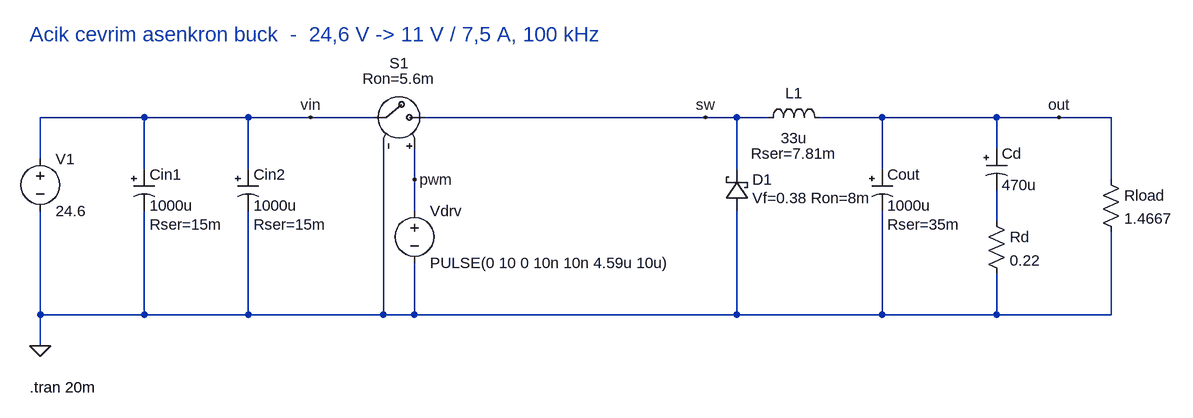
[diagram p0: schematic buck_guc_kati.asc]
buck_guc_kati.asc, the LTspice schematic file:
Version 4
SHEET 1 1760 900
WIRE -320 128 -320 64
WIRE -320 64 -160 64
WIRE -160 64 0 64
WIRE 0 64 96 64
WIRE 96 64 192 64
WIRE 272 64 704 64
WIRE 704 64 752 64
WIRE 752 64 800 64
WIRE 880 64 976 64
WIRE 976 64 1152 64
WIRE 1152 64 1248 64
WIRE 1248 64 1328 64
WIRE -320 208 -320 368
WIRE -320 368 -320 416
WIRE -160 64 -160 144
WIRE -160 208 -160 368
WIRE 0 64 0 144
WIRE 0 208 0 368
WIRE 208 112 208 368
WIRE 256 112 256 160
WIRE 256 160 256 208
WIRE 256 288 256 368
WIRE 752 64 752 144
WIRE 752 208 752 368
WIRE 976 64 976 144
WIRE 976 208 976 368
WIRE 1152 64 1152 112
WIRE 1152 176 1152 224
WIRE 1152 304 1152 368
WIRE 1328 64 1328 160
WIRE 1328 240 1328 368
WIRE -320 368 -160 368
WIRE -160 368 0 368
WIRE 0 368 208 368
WIRE 208 368 256 368
WIRE 256 368 752 368
WIRE 752 368 976 368
WIRE 976 368 1152 368
WIRE 1152 368 1328 368
FLAG -320 416 0
FLAG 96 64 vin
FLAG 704 64 sw
FLAG 1248 64 out
FLAG 256 160 pwm
SYMBOL voltage -320 112 R0
SYMATTR InstName V1
SYMATTR Value 24.6
SYMBOL polcap -176 144 R0
WINDOW 39 24 85 Left 2
SYMATTR InstName Cin1
SYMATTR Value 1000u
SYMATTR SpiceLine Rser=15m
SYMBOL polcap -16 144 R0
WINDOW 39 24 85 Left 2
SYMATTR InstName Cin2
SYMATTR Value 1000u
SYMATTR SpiceLine Rser=15m
SYMBOL anahtar 176 64 R270
WINDOW 0 68 56 VTop 2
WINDOW 39 44 56 VTop 2
SYMATTR InstName S1
SYMATTR Value anahtar
SYMATTR SpiceLine Ron=5.6m
SYMBOL voltage 256 192 R0
SYMATTR InstName Vdrv
SYMATTR Value PULSE(0 10 0 10n 10n 4.59u 10u)
SYMBOL diyot 768 208 R180
WINDOW 0 -8 48 Right 2
WINDOW 39 -8 20 Right 2
SYMATTR InstName D1
SYMATTR Value diyot
SYMATTR SpiceLine Vf=0.38 Ron=8m
SYMBOL ind 784 80 R270
WINDOW 0 38 56 VTop 2
WINDOW 3 0 56 VBottom 2
WINDOW 39 -24 56 VBottom 2
SYMATTR InstName L1
SYMATTR Value 33u
SYMATTR SpiceLine Rser=7.81m
SYMBOL polcap 960 144 R0
WINDOW 39 24 85 Left 2
SYMATTR InstName Cout
SYMATTR Value 1000u
SYMATTR SpiceLine Rser=35m
SYMBOL polcap 1136 112 R0
SYMATTR InstName Cd
SYMATTR Value 470u
SYMBOL res 1136 208 R0
SYMATTR InstName Rd
SYMATTR Value 0.22
SYMBOL res 1312 144 R0
SYMATTR InstName Rload
SYMATTR Value 1.4667
TEXT -336 -64 Left 3 ;Acik cevrim asenkron buck  -  24,6 V -> 11 V / 7,5 A, 100 kHz
TEXT -336 480 Left 2 !.tran 20m

The netlist it stands for:
* buck_guc_kati.asc
V1 vin 0 24.6
Cin1 vin 0 1000u Rser=15m
Cin2 vin 0 1000u Rser=15m
XS1 vin sw pwm 0 anahtar Ron=5.6m  ; pins A B NC+ NC-
Vdrv pwm 0 PULSE(0 10 0 10n 10n 4.59u 10u)
XD1 0 sw diyot Vf=0.38 Ron=8m  ; pins + -
L1 sw out 33u Rser=7.81m
Cout out 0 1000u Rser=35m
Cd out N001 470u
Rd N001 0 0.22
Rload out 0 1.4667
* Acik cevrim asenkron buck  -  24,6 V -> 11 V / 7,5 A, 100 kHz
.tran 20m
.lib idealler.lib
.backanno
.end